# Altium schematic sheet Top-Sheet.SchDoc
size A4; SheetNumber: 1; SheetTotal: 4
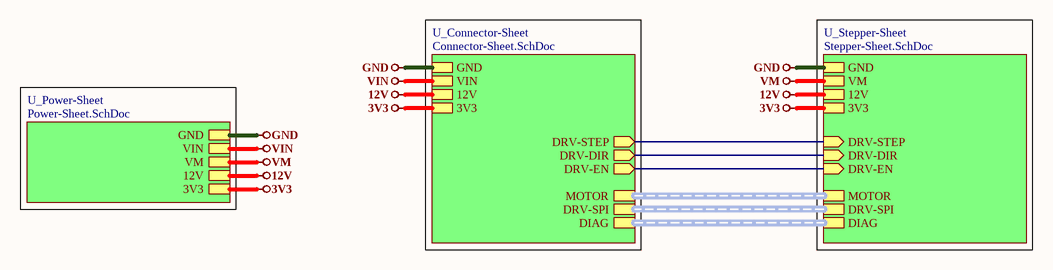
[diagram p0: Top-Sheet.SchDoc]

## Sub-sheets
U_Connector-Sheet = Connector-Sheet.SchDoc: GND, 3V3, 12V, VIN, MOTOR (harness MOTOR), DRV-SPI (harness DRV-SPI), DIAG (harness DIAG), DRV-STEP (out), DRV-DIR (out), DRV-EN (out)
U_Power-Sheet = Power-Sheet.SchDoc: GND, 3V3, 12V, VM, VIN
U_Stepper-Sheet = Stepper-Sheet.SchDoc: GND, 3V3, 12V, VM, MOTOR (harness MOTOR), DRV-SPI (harness DRV-SPI), DIAG (harness DIAG), DRV-STEP (in), DRV-DIR (in), DRV-EN (in)

## Nets
3V3: sheet U_Power-Sheet/3V3, sheet U_Stepper-Sheet/3V3, sheet U_Connector-Sheet/3V3
12V: sheet U_Power-Sheet/12V, sheet U_Stepper-Sheet/12V, sheet U_Connector-Sheet/12V
GND: sheet U_Power-Sheet/GND, sheet U_Stepper-Sheet/GND, sheet U_Connector-Sheet/GND
VIN: sheet U_Power-Sheet/VIN, sheet U_Connector-Sheet/VIN
VM: sheet U_Power-Sheet/VM, sheet U_Stepper-Sheet/VM
(unnamed): sheet U_Stepper-Sheet/DRV-STEP, sheet U_Connector-Sheet/DRV-STEP
(unnamed): sheet U_Stepper-Sheet/DRV-DIR, sheet U_Connector-Sheet/DRV-DIR
(unnamed): sheet U_Stepper-Sheet/DRV-EN, sheet U_Connector-Sheet/DRV-EN

## Buses and harness runs
harness sheet U_Connector-Sheet/DIAG = sheet U_Stepper-Sheet/DIAG
harness sheet U_Connector-Sheet/DRV-SPI = sheet U_Stepper-Sheet/DRV-SPI
harness sheet U_Connector-Sheet/MOTOR = sheet U_Stepper-Sheet/MOTOR

## Notes on the sheet
- File:
- Title:
- Date:
- Page
- Num:
- Total:
- Drawn By: Huzaifa Ali